# Altium schematic sheet DDRC_Section.SchDoc: =Projectname
size A4; DocumentNumber: 9; SheetNumber: 9; SheetTotal: 27
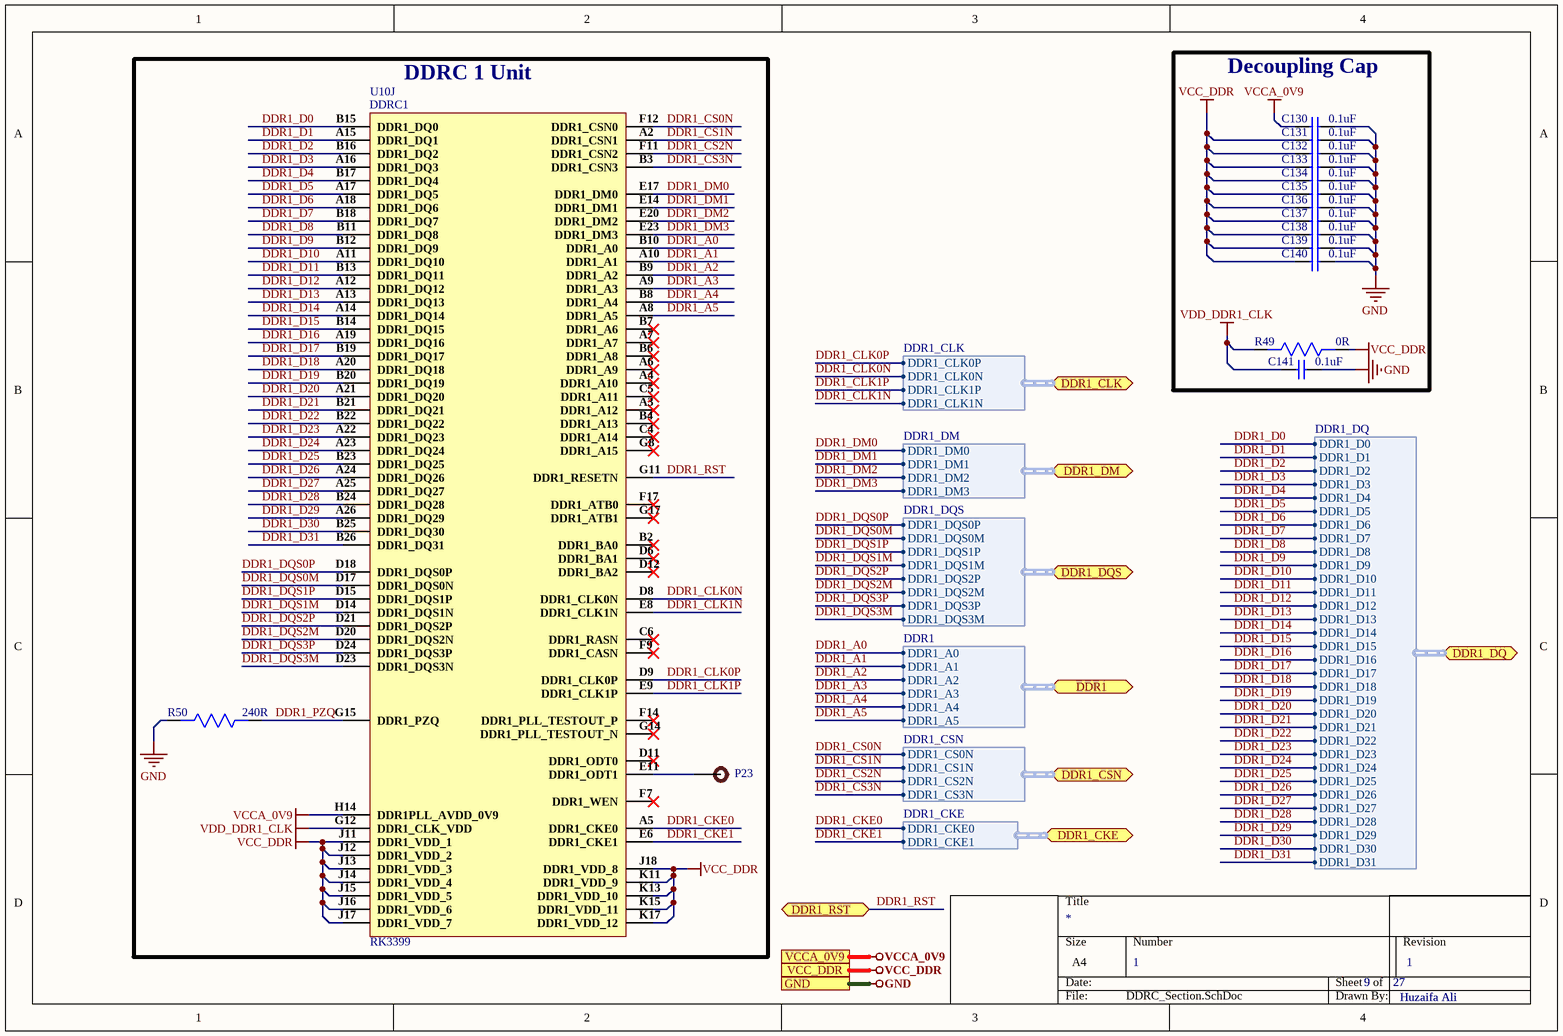
[diagram p0: DDRC_Section.SchDoc]

## Parts
C130  0.1uF  [Cap0402]
C131  0.1uF  [Cap0402]
C132  0.1uF  [Cap0402]
C133  0.1uF  [Cap0402]
C134  0.1uF  [Cap0402]
C135  0.1uF  [Cap0402]
C136  0.1uF  [Cap0402]
C137  0.1uF  [Cap0402]
C138  0.1uF  [Cap0402]
C139  0.1uF  [Cap0402]
C140  0.1uF  [Cap0402]
C141  0.1uF  [Cap0402]
P23  Test Point  [TEST POINT]  (value not drawn)
R49  0R  [Res0603]
R50  240R  [Res0603]
U10  RK3399  [RK3399]  (part J of 34)

## Blocks framed on the sheet
DDRC 1 Unit: P23 R50 U10
Decoupling Cap: C130-C141 R49

## Ports
DDR1 (bidir, harness DDR1), DDR1_CKE (bidir, harness DDR1_CKE), DDR1_CLK (bidir, harness DDR1_CLK), DDR1_CSN (bidir, harness DDR1_CSN), DDR1_DM (bidir, harness DDR1_DM), DDR1_DQ (bidir, harness DDR1_DQ), DDR1_DQS (bidir, harness DDR1_DQS), DDR1_RST (bidir), GND, VCC_DDR, VCCA_0V9

## Harnesses
DDR1_DQ: DDR1_D0, DDR1_D1, DDR1_D2, DDR1_D3, DDR1_D4, DDR1_D5, DDR1_D6, DDR1_D7, DDR1_D8, DDR1_D9, DDR1_D10, DDR1_D11, DDR1_D12, DDR1_D13, DDR1_D14, DDR1_D15, DDR1_D16, DDR1_D17, DDR1_D18, DDR1_D19, DDR1_D20, DDR1_D21, DDR1_D22, DDR1_D23, DDR1_D24, DDR1_D25, DDR1_D26, DDR1_D27, DDR1_D28, DDR1_D29, DDR1_D30, DDR1_D31
DDR1_DM: DDR1_DM0, DDR1_DM1, DDR1_DM2, DDR1_DM3
DDR1_DQS: DDR1_DQS0P, DDR1_DQS0M, DDR1_DQS1P, DDR1_DQS1M, DDR1_DQS2P, DDR1_DQS2M, DDR1_DQS3P, DDR1_DQS3M
DDR1: DDR1_A0, DDR1_A1, DDR1_A2, DDR1_A3, DDR1_A4, DDR1_A5
DDR1_CSN: DDR1_CS0N, DDR1_CS1N, DDR1_CS2N, DDR1_CS3N
DDR1_CKE: DDR1_CKE0, DDR1_CKE1
DDR1_CLK: DDR1_CLK0P, DDR1_CLK0N, DDR1_CLK1P, DDR1_CLK1N

## Nets
GND: C130.2 C131.2 C132.2 C133.2 C134.2 C135.2 C136.2 C137.2 C138.2 C139.2 C140.2 C141.2 R50.2 ; port GND
VCC_DDR: C131.1 C132.1 C133.1 C134.1 C135.1 C136.1 C137.1 C138.1 C139.1 C140.1 R49.1 U10.J11(DDR1_VDD_1) U10.J12(DDR1_VDD_2) U10.J13(DDR1_VDD_3) U10.J14(DDR1_VDD_4) U10.J15(DDR1_VDD_5) U10.J16(DDR1_VDD_6) U10.J17(DDR1_VDD_7) U10.J18(DDR1_VDD_8) U10.K11(DDR1_VDD_9) U10.K13(DDR1_VDD_10) U10.K15(DDR1_VDD_11) U10.K17(DDR1_VDD_12) ; port VCC_DDR
VCCA_0V9: C130.1 U10.H14(DDR1PLL_AVDD_0V9) ; port VCCA_0V9
VDD_DDR1_CLK: C141.1 R49.2 U10.G12(DDR1_CLK_VDD)
DDR1_A0: U10.B10(DDR1_A0) ; port DDR1.DDR1_A0
DDR1_A1: U10.A10(DDR1_A1) ; port DDR1.DDR1_A1
DDR1_A2: U10.B9(DDR1_A2) ; port DDR1.DDR1_A2
DDR1_A3: U10.A9(DDR1_A3) ; port DDR1.DDR1_A3
DDR1_A4: U10.B8(DDR1_A4) ; port DDR1.DDR1_A4
DDR1_A5: U10.A8(DDR1_A5) ; port DDR1.DDR1_A5
DDR1_CKE0: U10.A5(DDR1_CKE0) ; port DDR1_CKE.DDR1_CKE0
DDR1_CKE1: U10.E6(DDR1_CKE1) ; port DDR1_CKE.DDR1_CKE1
DDR1_CLK0N: U10.D8(DDR1_CLK0N) ; port DDR1_CLK.DDR1_CLK0N
DDR1_CLK0P: U10.D9(DDR1_CLK0P) ; port DDR1_CLK.DDR1_CLK0P
DDR1_CLK1N: U10.E8(DDR1_CLK1N) ; port DDR1_CLK.DDR1_CLK1N
DDR1_CLK1P: U10.E9(DDR1_CLK1P) ; port DDR1_CLK.DDR1_CLK1P
DDR1_CS0N: U10.F12(DDR1_CSN0) ; port DDR1_CSN.DDR1_CS0N
DDR1_CS1N: U10.A2(DDR1_CSN1) ; port DDR1_CSN.DDR1_CS1N
DDR1_CS2N: U10.F11(DDR1_CSN2) ; port DDR1_CSN.DDR1_CS2N
DDR1_CS3N: U10.B3(DDR1_CSN3) ; port DDR1_CSN.DDR1_CS3N
DDR1_D0: U10.B15(DDR1_DQ0) ; port DDR1_DQ.DDR1_D0
DDR1_D1: U10.A15(DDR1_DQ1) ; port DDR1_DQ.DDR1_D1
DDR1_D2: U10.B16(DDR1_DQ2) ; port DDR1_DQ.DDR1_D2
DDR1_D3: U10.A16(DDR1_DQ3) ; port DDR1_DQ.DDR1_D3
DDR1_D4: U10.B17(DDR1_DQ4) ; port DDR1_DQ.DDR1_D4
DDR1_D5: U10.A17(DDR1_DQ5) ; port DDR1_DQ.DDR1_D5
DDR1_D6: U10.A18(DDR1_DQ6) ; port DDR1_DQ.DDR1_D6
DDR1_D7: U10.B18(DDR1_DQ7) ; port DDR1_DQ.DDR1_D7
DDR1_D8: U10.B11(DDR1_DQ8) ; port DDR1_DQ.DDR1_D8
DDR1_D9: U10.B12(DDR1_DQ9) ; port DDR1_DQ.DDR1_D9
DDR1_D10: U10.A11(DDR1_DQ10) ; port DDR1_DQ.DDR1_D10
DDR1_D11: U10.B13(DDR1_DQ11) ; port DDR1_DQ.DDR1_D11
DDR1_D12: U10.A12(DDR1_DQ12) ; port DDR1_DQ.DDR1_D12
DDR1_D13: U10.A13(DDR1_DQ13) ; port DDR1_DQ.DDR1_D13
DDR1_D14: U10.A14(DDR1_DQ14) ; port DDR1_DQ.DDR1_D14
DDR1_D15: U10.B14(DDR1_DQ15) ; port DDR1_DQ.DDR1_D15
DDR1_D16: U10.A19(DDR1_DQ16) ; port DDR1_DQ.DDR1_D16
DDR1_D17: U10.B19(DDR1_DQ17) ; port DDR1_DQ.DDR1_D17
DDR1_D18: U10.A20(DDR1_DQ18) ; port DDR1_DQ.DDR1_D18
DDR1_D19: U10.B20(DDR1_DQ19) ; port DDR1_DQ.DDR1_D19
DDR1_D20: U10.A21(DDR1_DQ20) ; port DDR1_DQ.DDR1_D20
DDR1_D21: U10.B21(DDR1_DQ21) ; port DDR1_DQ.DDR1_D21
DDR1_D22: U10.B22(DDR1_DQ22) ; port DDR1_DQ.DDR1_D22
DDR1_D23: U10.A22(DDR1_DQ23) ; port DDR1_DQ.DDR1_D23
DDR1_D24: U10.A23(DDR1_DQ24) ; port DDR1_DQ.DDR1_D24
DDR1_D25: U10.B23(DDR1_DQ25) ; port DDR1_DQ.DDR1_D25
DDR1_D26: U10.A24(DDR1_DQ26) ; port DDR1_DQ.DDR1_D26
DDR1_D27: U10.A25(DDR1_DQ27) ; port DDR1_DQ.DDR1_D27
DDR1_D28: U10.B24(DDR1_DQ28) ; port DDR1_DQ.DDR1_D28
DDR1_D29: U10.A26(DDR1_DQ29) ; port DDR1_DQ.DDR1_D29
DDR1_D30: U10.B25(DDR1_DQ30) ; port DDR1_DQ.DDR1_D30
DDR1_D31: U10.B26(DDR1_DQ31) ; port DDR1_DQ.DDR1_D31
DDR1_DM0: U10.E17(DDR1_DM0) ; port DDR1_DM.DDR1_DM0
DDR1_DM1: U10.E14(DDR1_DM1) ; port DDR1_DM.DDR1_DM1
DDR1_DM2: U10.E20(DDR1_DM2) ; port DDR1_DM.DDR1_DM2
DDR1_DM3: U10.E23(DDR1_DM3) ; port DDR1_DM.DDR1_DM3
DDR1_DQS0M: U10.D17(DDR1_DQS0N) ; port DDR1_DQS.DDR1_DQS0M
DDR1_DQS0P: U10.D18(DDR1_DQS0P) ; port DDR1_DQS.DDR1_DQS0P
DDR1_DQS1M: U10.D14(DDR1_DQS1N) ; port DDR1_DQS.DDR1_DQS1M
DDR1_DQS1P: U10.D15(DDR1_DQS1P) ; port DDR1_DQS.DDR1_DQS1P
DDR1_DQS2M: U10.D20(DDR1_DQS2N) ; port DDR1_DQS.DDR1_DQS2M
DDR1_DQS2P: U10.D21(DDR1_DQS2P) ; port DDR1_DQS.DDR1_DQS2P
DDR1_DQS3M: U10.D23(DDR1_DQS3N) ; port DDR1_DQS.DDR1_DQS3M
DDR1_DQS3P: U10.D24(DDR1_DQS3P) ; port DDR1_DQS.DDR1_DQS3P
DDR1_PZQ: R50.1 U10.G15(DDR1_PZQ)
DDR1_RST: U10.G11(DDR1_RESETN) ; port DDR1_RST
NetP23_1: P23.1 U10.E11(DDR1_ODT1)

Not connected (* = marked no-connect by the designer): U10 A3(DDR1_A12)* A4(DDR1_A10)* A6(DDR1_A9)* A7(DDR1_A7)* B2(DDR1_BA0)* B4(DDR1_A13)* B6(DDR1_A8)* B7(DDR1_A6)* C4(DDR1_A14)* C5(DDR1_A11)* C6(DDR1_RASN)* D6(DDR1_BA1)* D11(DDR1_ODT0)* D12(DDR1_BA2)* F7(DDR1_WEN)* F9(DDR1_CASN)* F14(DDR1_PLL_TESTOUT_P)* F17(DDR1_ATB0)* G8(DDR1_A15)* G14(DDR1_PLL_TESTOUT_N)* G17(DDR1_ATB1)*

## Notes on the sheet
- Huzaifa Ali
- 1
- (in symbol RK3399, part J) DDRC1

## Library data of the parts
C130-C141 = CC0402KRX5R6BB104: CAP CER 0.1UF 10V X5R 0402; Manufacturer: Yageo; Capacitance: 100nF; Tolerance: 10%; Dissipation Factor: 5%; Insulation Resistance: 10GR; Supplier 1: Digi-Key; Manufacturer Part Number: CC0402KRX5R6BB104; RoHS: Yes; Category: Ceramic Capacitors; Stock 1: 6385580; Pricing 1: 1=0.10000, 10=0.02700, 50=0.01500, 100=0.01220, 500=0.00874, 1000=0.00687, 2500=0.00625, 5000=0.00575 (USD); Mount: Surface Mount; Case/Package: 0402; Number of Pins: 2; Case Code (Imperial): 0402; Case Code (Metric): 1005; Min Operating Temperature: -55°C; Max Operating Temperature: 85°C; Dielectric: X5R; Packaging: Tape and Reel; Voltage Rating: 10V; Package Quantity: 1; Termination: SMD/SMT; Voltage Rating (DC): 10V; Series: CC; Length: 1mm; Width: 0.02inch; Height: 0.5mm; Depth: 0.5mm; Thickness: 0.022inch; Radiation Hardening: No; RoHS Compliant: Yes; REACH SVHC: No SVHC; Lead Free: Lead Free; Halogen Free: Halogen Free; ComponentLink1URL: https://datasheet.ciiva.com/144/mlccorderingcode-144029.pdf?src-supplier=Digi-Key; ComponentLink1Description: https://datasheet.ciiva.com/144/mlccorderingcode-144029.pdf?src-supplier=Digi-Key; ComponentLink2URL: https://datasheet.ciiva.com/144/mlccorderingcode-144028.pdf?src-supplier=Digi-Key; ComponentLink2Description: https://datasheet.ciiva.com/144/mlccorderingcode-144028.pdf?src-supplier=Digi-Key; ComponentLink3URL: https://datasheet.ciiva.com/144/mlccorderingcode-144030.pdf?src-supplier=Digi-Key; ComponentLink3Description: https://datasheet.ciiva.com/144/mlccorderingcode-144030.pdf?src-supplier=Digi-Key; ComponentLink4URL: https://datasheet.ciiva.com/7978/1359354-7978091.pdf?src-supplier=Element14; ComponentLink4Description: https://datasheet.ciiva.com/7978/1359354-7978091.pdf?src-supplier=Element14; ComponentLink5URL: https://datasheet.ciiva.com/11587/upy-gphc-x5r-4v-to-50v-12-11587302.pdf?src-supplier=Avnet; ComponentLink5Description: https://datasheet.ciiva.com/11587/upy-gphc-x5r-4v-to-50v-12-11587302.pdf?src-supplier=Avnet; Supplier Part Number 1: 311-1336-1-ND
P23 = TEST POINT: Test Point ON
R49 = RC0603FR-070RL: RES SMD 0R, 1%, 0.1W, 0603; Manufacturer: Yageo; Resistance: 0mR; Power Rating: 100mW; Voltage Rating (DC): 50V; Temperature Coefficient: 200ppm/°C; Current Rating: 1A; Working Voltage: 75V; Supplier 1: Arrow Electronics; Manufacturer Part Number: RC0603FR-070RL; RoHS: Yes; Category: Chip SMD Resistors; Stock 1: 1270000; Pricing 1: 5000=0.00320, 5000=0.00490, 50000=0.00450, 500000=0.00250, 2500000=0.00150 (USD); Case/Package: 0603; Number of Pins: 2; Contact Plating: Tin,Matte; Case Code (Metric): 1608; Case Code (Imperial): 0603; Min Operating Temperature: -55°C; Max Operating Temperature: 155°C; Resistor Type: Thick Film; Packaging: Tape and Reel; Tolerance: 1%; Package Quantity: 5000; Voltage Rating: 50V; Number of Terminations: 2; Termination: SMD/SMT; Max Power Dissipation: 100mW; Features: Moisture Resistant; Length: 1.6mm; Width: 0.031inch; Height: 0.45mm; Depth: 0.8mm; Radiation Hardening: No; REACH SVHC: No SVHC; Lead Free: Lead Free; Military Standard: Not; ComponentLink1URL: https://datasheet.ciiva.com/11808/0900766b80f96399-11808172.pdf?src-supplier=RSComponents; ComponentLink1Description: https://datasheet.ciiva.com/11808/0900766b80f96399-11808172.pdf?src-supplier=RSComponents; ComponentLink2URL: https://datasheet.ciiva.com/5558/rc0603-272842-5558341.pdf?src-supplier=Mouser; ComponentLink2Description: https://datasheet.ciiva.com/5558/rc0603-272842-5558341.pdf?src-supplier=Mouser; ComponentLink3URL: https://datasheet.ciiva.com/46382/443971-46382072.pdf?src-supplier=Element14; ComponentLink3Description: https://datasheet.ciiva.com/46382/443971-46382072.pdf?src-supplier=Element14; ComponentLink4URL: https://datasheet.ciiva.com/29721/pyu-r-int-thick-7-29721178.pdf?src-supplier=Digi-Key; ComponentLink4Description: https://datasheet.ciiva.com/29721/pyu-r-int-thick-7-29721178.pdf?src-supplier=Digi-Key; ComponentLink5URL: https://datasheet.ciiva.com/5684/443971-5684699.pdf?src-supplier=Farnell; ComponentLink5Description: https://datasheet.ciiva.com/5684/443971-5684699.pdf?src-supplier=Farnell; ComponentLink6URL: https://datasheet.ciiva.com/7983/443971-7983627.pdf?src-supplier=Element14; ComponentLink6Description: https://datasheet.ciiva.com/7983/443971-7983627.pdf?src-supplier=Element14; ComponentLink7URL: https://datasheet.ciiva.com/29721/pyu-rc0603-51-rohs-l-4-29721179.pdf?src-supplier=Digi-Key; ComponentLink7Description: https://datasheet.ciiva.com/29721/pyu-rc0603-51-rohs-l-4-29721179.pdf?src-supplier=Digi-Key; ComponentLink8URL: https://datasheet.ciiva.com/22643/1868787-22643388.pdf?src-supplier=Element14; ComponentLink8Description: https://datasheet.ciiva.com/22643/1868787-22643388.pdf?src-supplier=Element14; Supplier Part Number 1: RC0603FR-070RL
R50 = RT0603BRD07240RL: RES SMD 240 OHM 0.1% 1/10W 0603; Manufacturer: Yageo; Power Rating: 100mW; Voltage Rating: 75V; Temperature Coefficient: 25ppm/°C; Voltage Rating (DC): 50V; Supplier 1: Arrow Electronics; Manufacturer Part Number: RT0603BRD07240RL; RoHS: Yes; Category: Chip SMD Resistors; Stock 1: 5; Pricing 1: 1=0.13940 (USD); Case/Package: 0603; Case Code (Imperial): 0603; Case Code (Metric): 1608; Contact Plating: Tin,Matte; Min Operating Temperature: -55°C; Max Operating Temperature: 125°C; Resistance: 240R; Tolerance: 0.1%; Packaging: Tape and Reel; Resistor Type: Thin Film; Number of Terminations: 2; Termination: SMD/SMT; Max Power Dissipation: 100mW; Features: Moisture Resistant; Series: RT; Construction: Rectangular; Length: 1.6mm; Width: 0.031inch; Height: 0.022inch; Depth: 0.8mm; Radiation Hardening: No; Military Standard: Not; Lead Free: Lead Free; RoHS Compliant: Yes; ComponentLink1URL: https://datasheet.ciiva.com/8886/pyu-rt-1-to-0-05-rohs-l-4-8886602.pdf?src-supplier=Avnet; ComponentLink1Description: https://datasheet.ciiva.com/8886/pyu-rt-1-to-0-05-rohs-l-4-8886602.pdf?src-supplier=Avnet; ComponentLink2URL: https://datasheet.ciiva.com/12799/pyu-rt-1-to-0-05-rohs-l-4-12799039.pdf?src-supplier=Mouser; ComponentLink2Description: https://datasheet.ciiva.com/12799/pyu-rt-1-to-0-05-rohs-l-4-12799039.pdf?src-supplier=Mouser; Supplier Part Number 1: RT0603BRD07240RL
U10 = RK3399: RK3399 CPU BGA for HD set-top box chip BGA Chipse; Manufacturer: Fuzhou Rockchip Electronics; ComponentLink1Description: Aliexpress; ComponentLink1URL: https://www.aliexpress.com/item/1005001971093459.html?spm=a2g0n.productlist.0.0.3c7csv8Qsv8Quh&browser_id=3ac7e9efb8074641aaabc4d871f09748&aff_trace_key=&aff_platform=msite&m_page_id=181389a08711fc2600d8cc522bab8d702dd4189be0&gclid=&pdp_npi=2%40dis%21USD%21%2123.6%21%21%21%21%21%402101d91e16545120399167831e8b89%21%21sea&algo_pvid=4303aedd-774c-4013-953d-920f10b55003; Manufacturer Part Number: RK3399; Footprint: FCBGA828